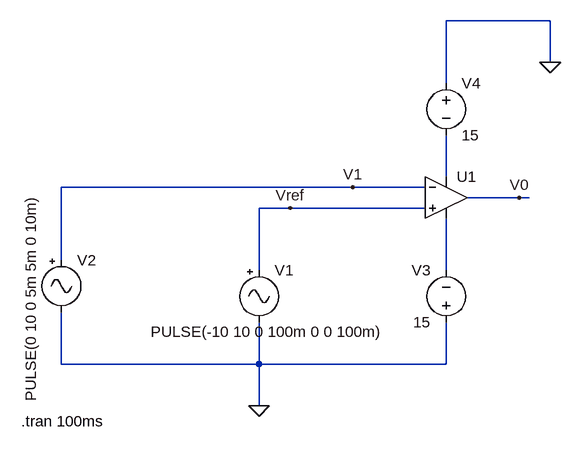
[diagram p0: schematic Draft4.asc]
Draft4.asc, the LTspice schematic file:
Version 4
SHEET 1 880 680
WIRE 608 -96 448 -96
WIRE 608 -32 608 -96
WIRE 448 0 448 -96
WIRE 448 144 448 80
WIRE 304 160 -144 160
WIRE 416 160 304 160
WIRE 560 176 480 176
WIRE 576 176 560 176
WIRE 208 192 160 192
WIRE 416 192 208 192
WIRE -144 272 -144 160
WIRE 160 288 160 192
WIRE 448 288 448 208
WIRE -144 432 -144 352
WIRE 160 432 160 368
WIRE 160 432 -144 432
WIRE 448 432 448 368
WIRE 448 432 160 432
WIRE 160 496 160 432
FLAG 160 496 0
FLAG 608 -32 0
FLAG 560 176 V0
FLAG 304 160 V1
FLAG 208 192 Vref
SYMBOL Misc\\signal 160 272 R0
WINDOW 3 -167 110 Left 2
WINDOW 123 0 0 Left 0
WINDOW 39 0 0 Left 0
SYMATTR InstName V1
SYMATTR Value PULSE(-10 10 0 100m 0 0 100m)
SYMBOL Misc\\signal -144 256 R0
WINDOW 3 -47 234 VLeft 2
WINDOW 123 0 0 Left 0
WINDOW 39 0 0 Left 0
SYMATTR InstName V2
SYMATTR Value PULSE(0 10 0 5m 5m 0 10m)
SYMBOL OpAmps\\UniversalOpAmp2 448 176 R0
SYMATTR InstName U1
SYMBOL voltage 448 384 R180
WINDOW 0 24 96 Left 2
WINDOW 3 24 16 Left 2
SYMATTR InstName V3
SYMATTR Value 15
SYMBOL voltage 448 -16 R0
SYMATTR InstName V4
SYMATTR Value 15
TEXT -206 520 Left 2 !.tran 100ms

The netlist it stands for:
* Draft4.asc
V1 Vref 0 PULSE(-10 10 0 100m 0 0 100m)
V2 V1 0 PULSE(0 10 0 5m 5m 0 10m)
XU1 Vref V1 N001 N002 V0 level2 Avol=1Meg GBW=10Meg Slew=10Meg Ilimit=25m Rail=0 Vos=0 En=0 Enk=0 In=0 Ink=0 Rin=500Meg  ; pins In+ In- V+ V- OUT
V3 0 N002 15
V4 0 N001 15
.tran 100ms
.lib UniversalOpAmp2.lib
.backanno
.end